# EasyEDA Pro project six-port-baseboard-v01.epro, schematic 六接口底板_V01, sheets 11 to 12 of 12

## Sheets
11 11_RL-RR支路无源器件: Schematic Name: 六接口底板_V01
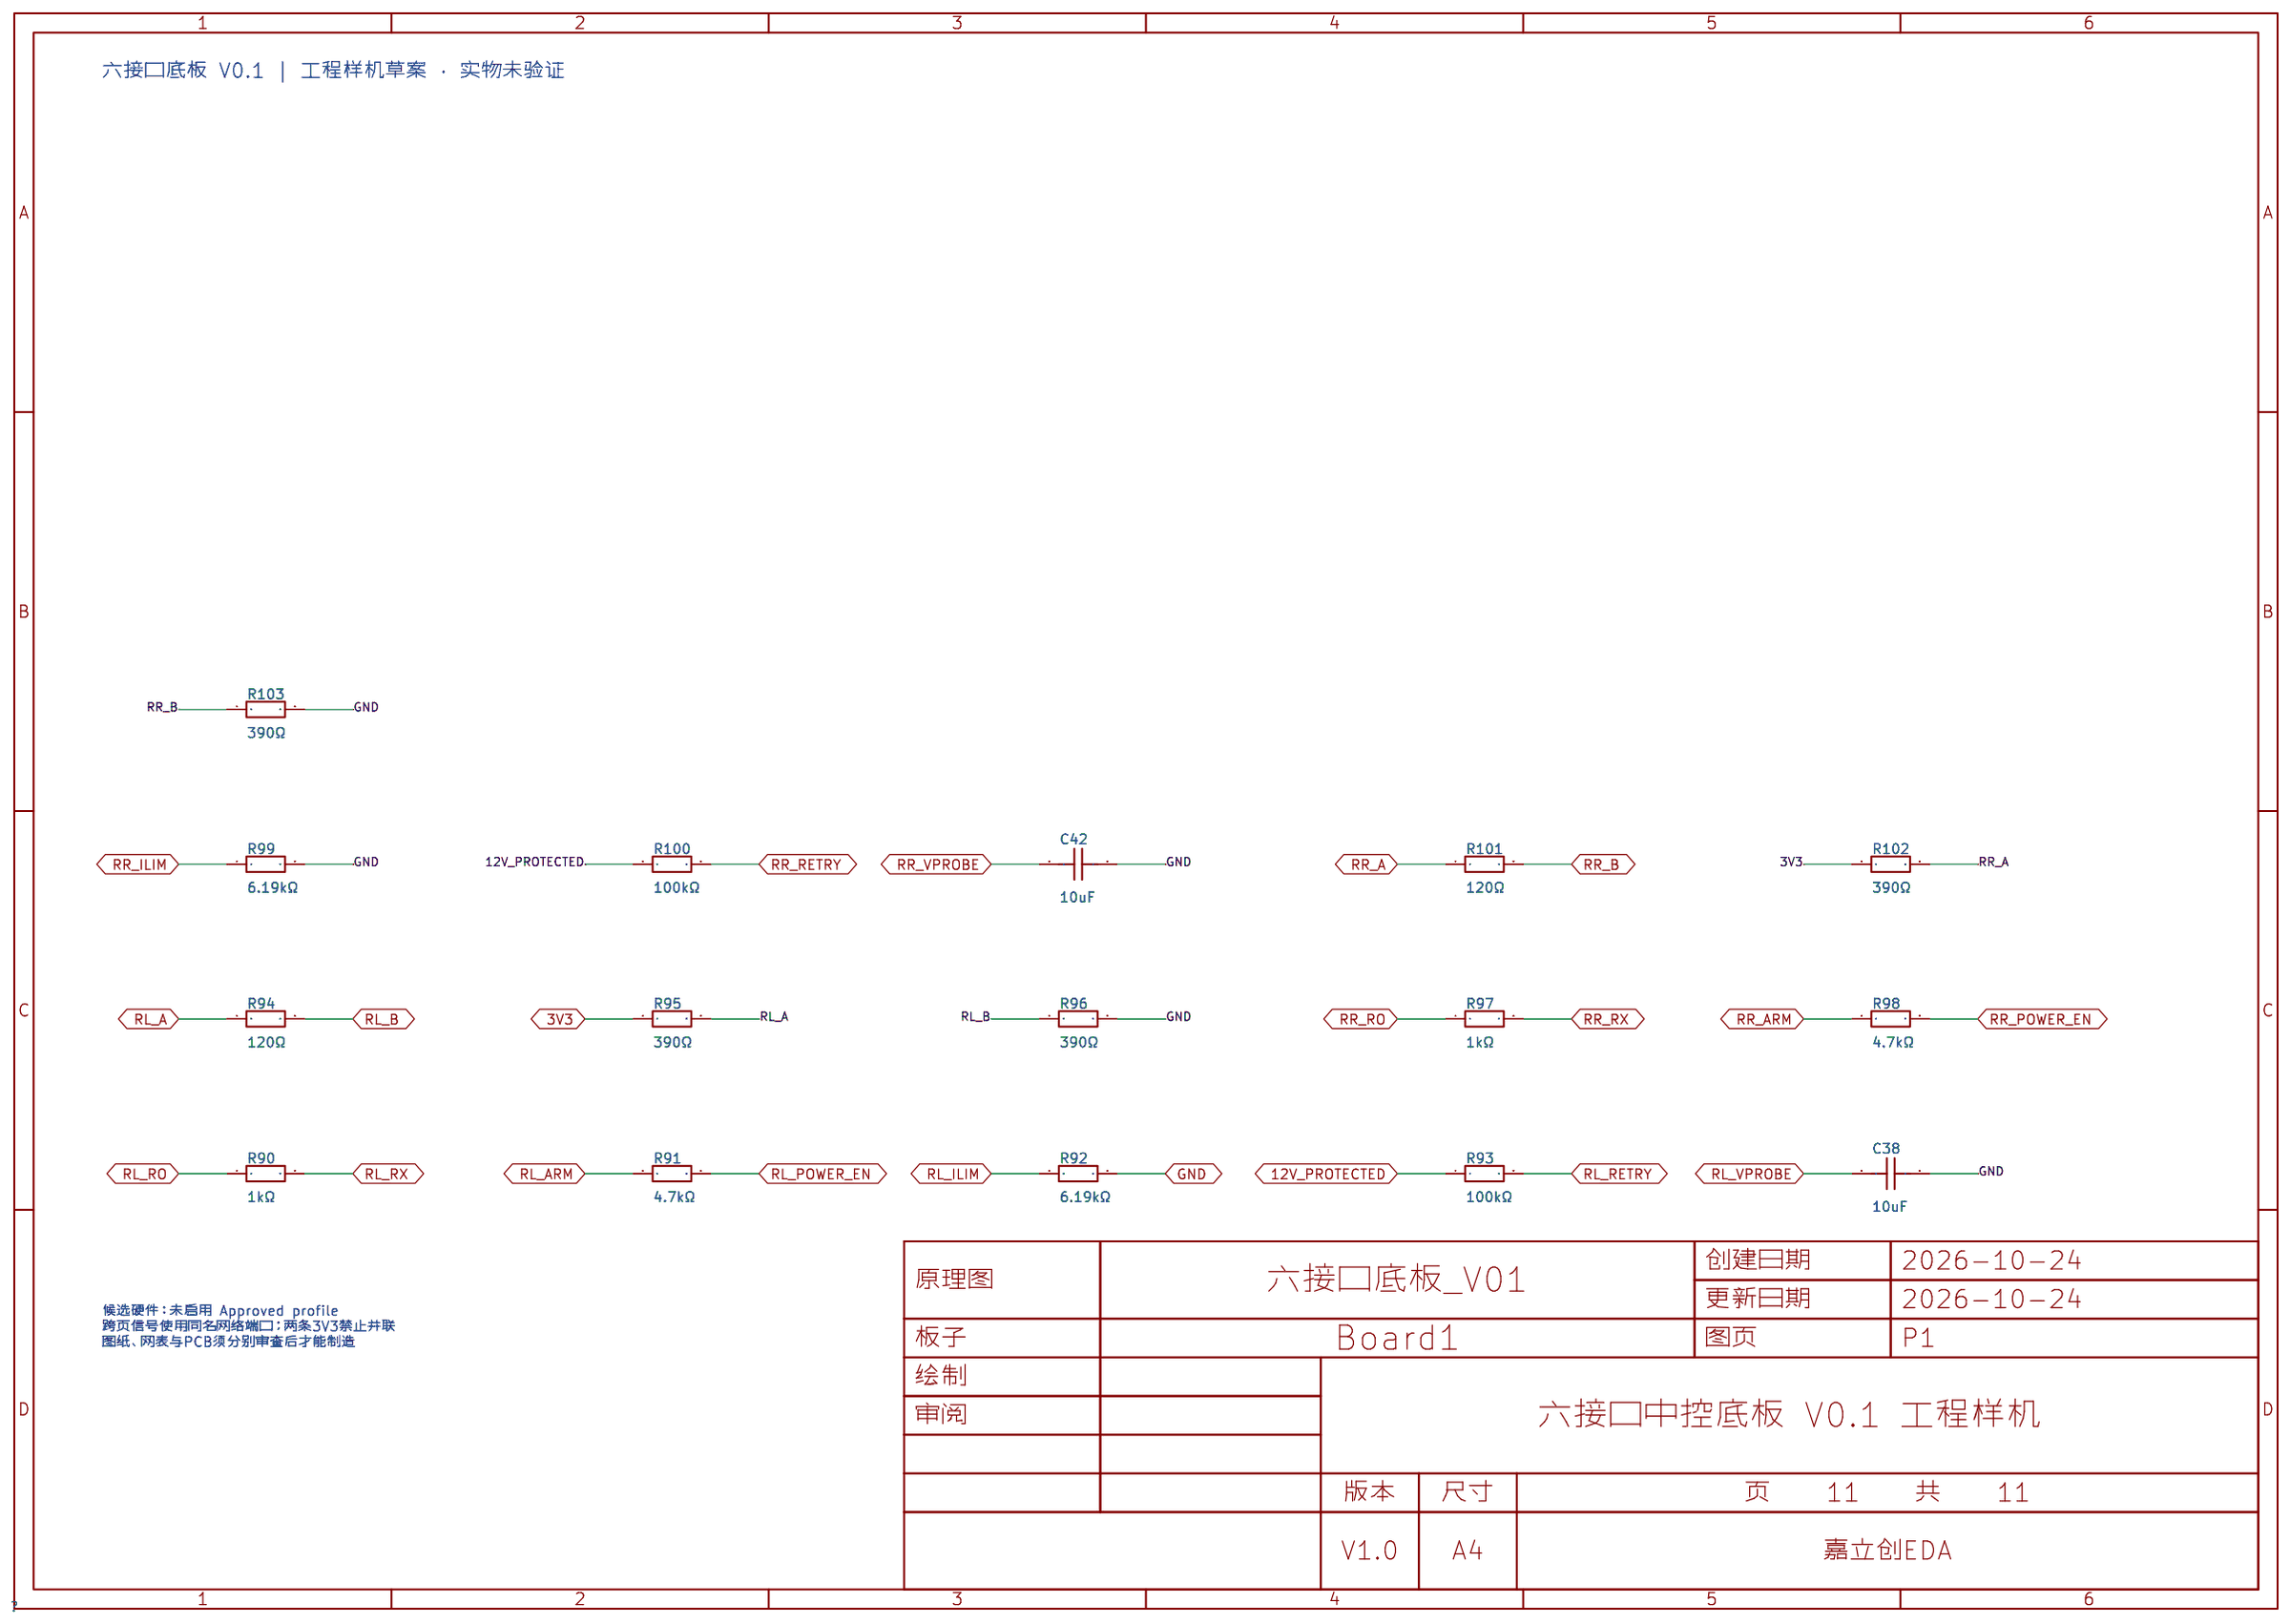
[diagram p10: 11_RL-RR支路无源器件]
12 12_BL-BR支路无源器件: Schematic Name: 六接口底板_V01
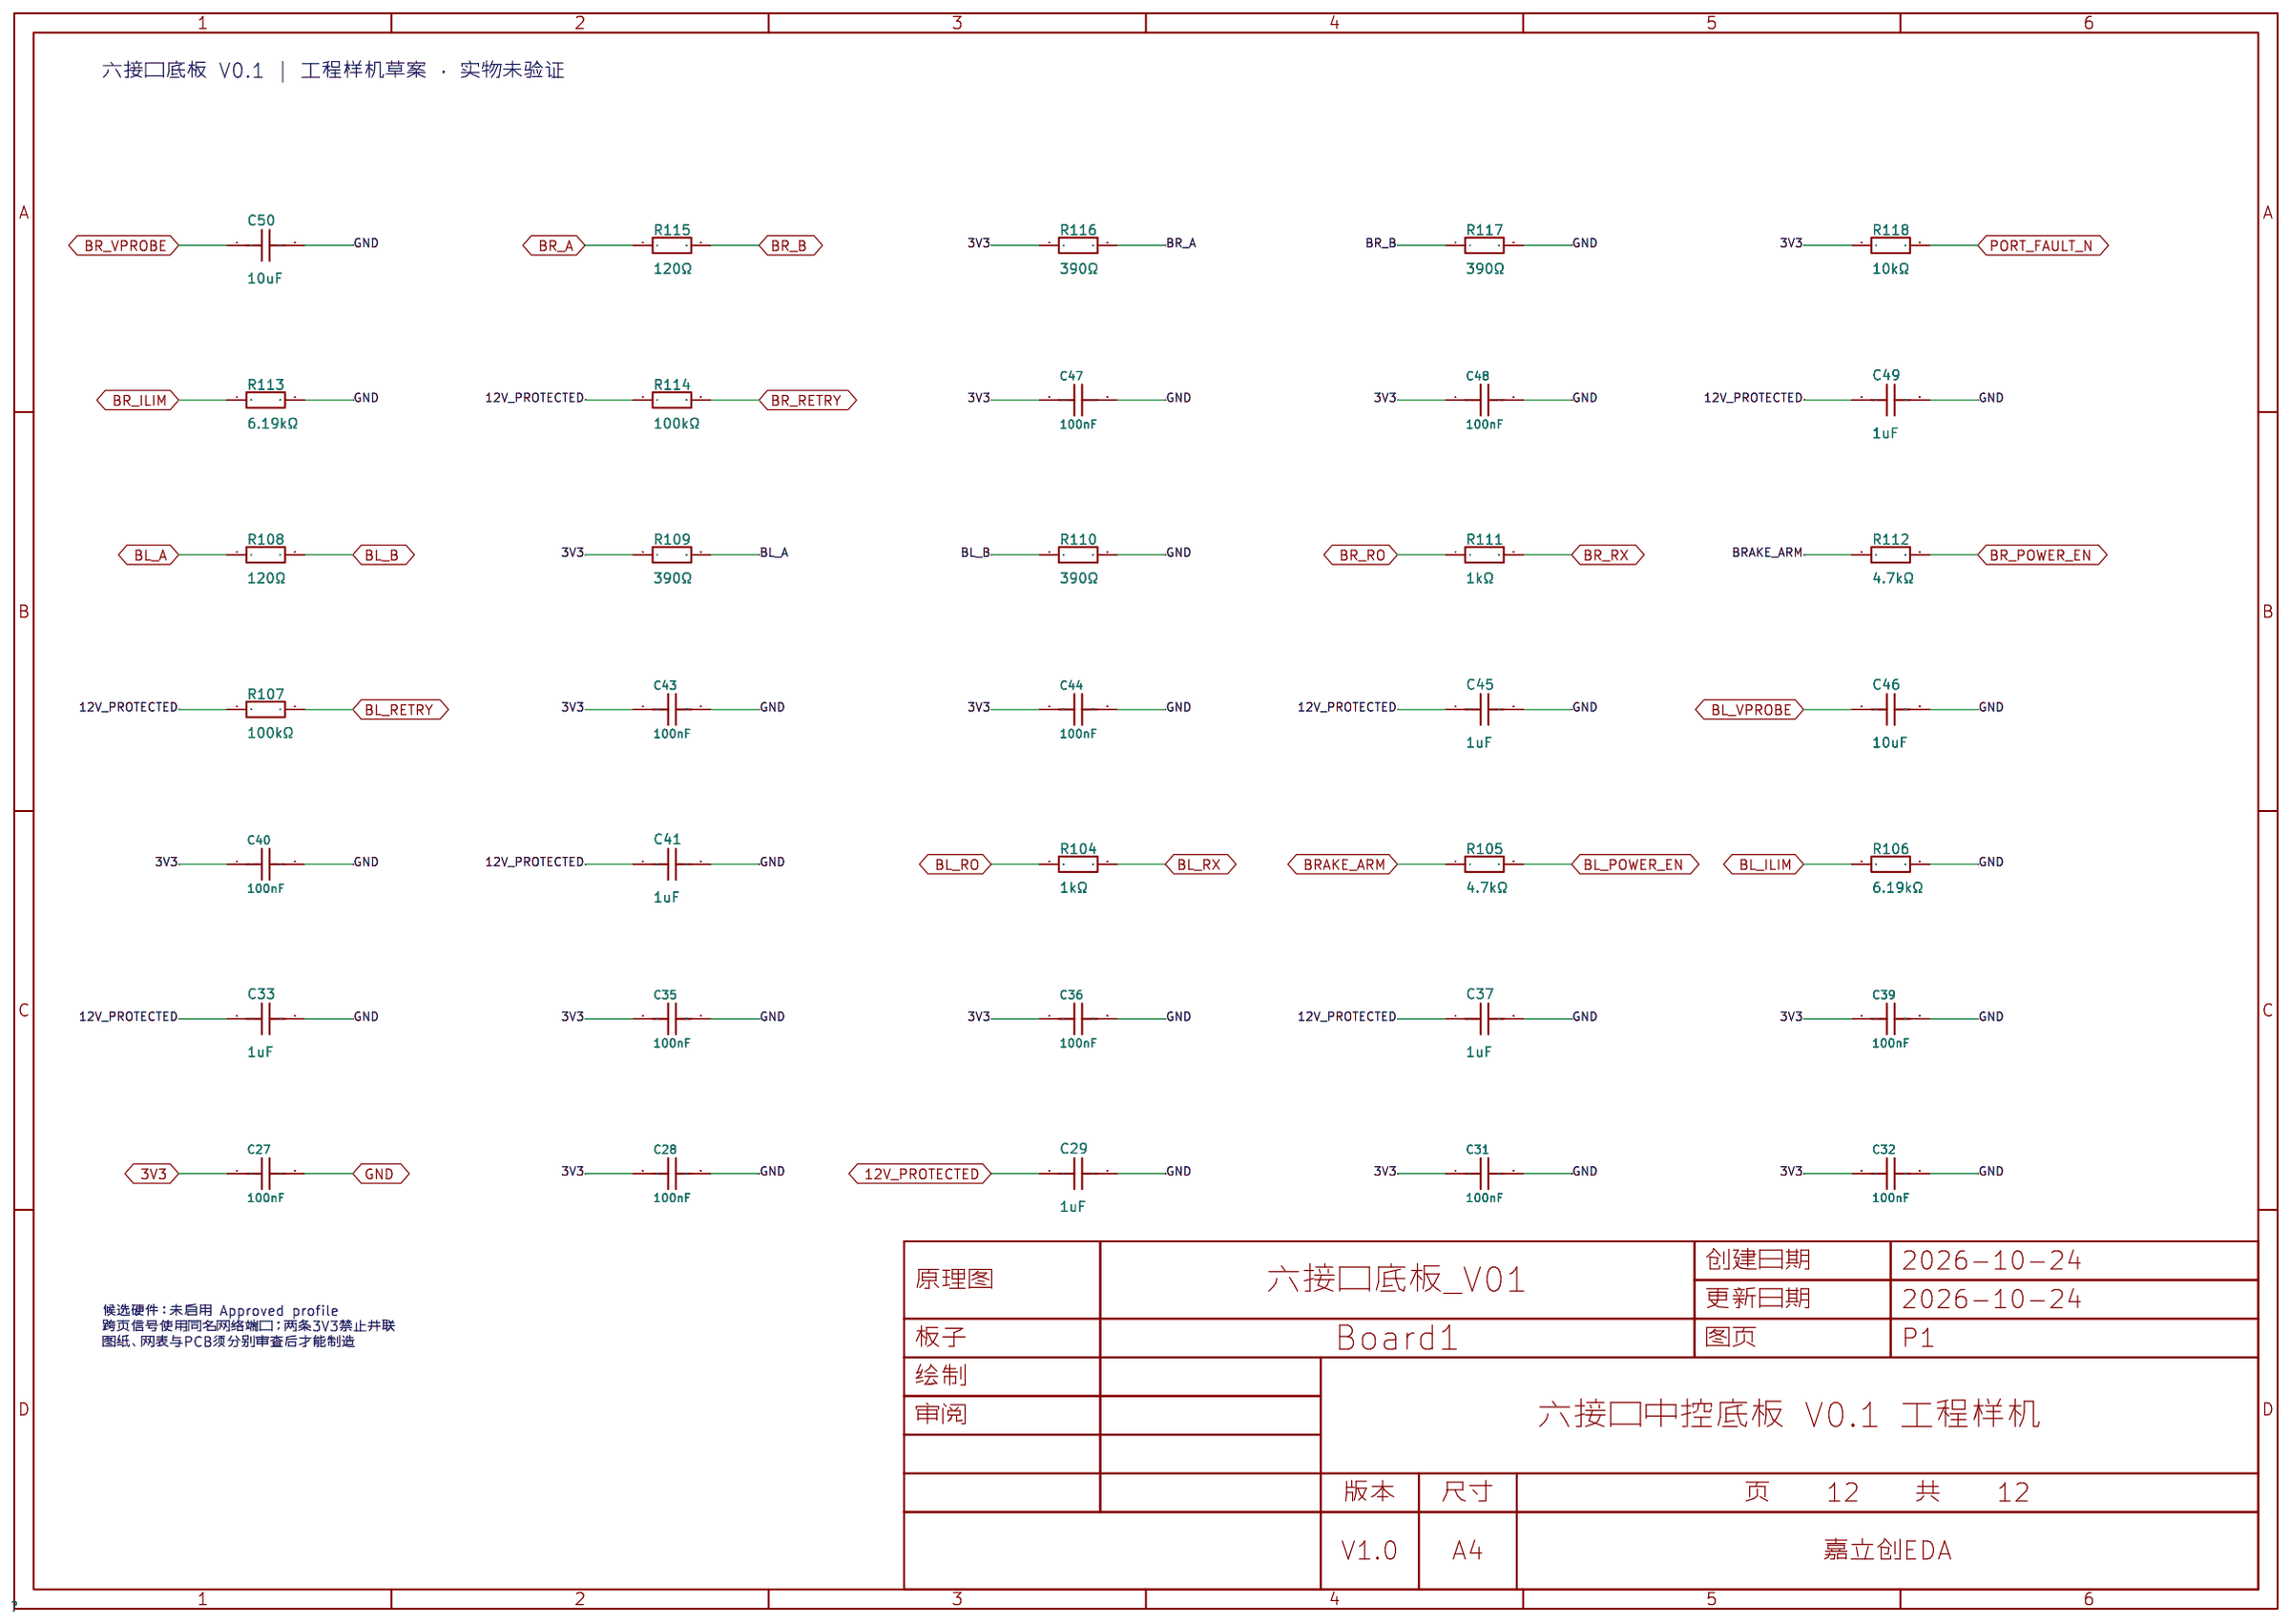
[diagram p11: 12_BL-BR支路无源器件]

## Parts
sheet 11_RL-RR支路无源器件
C38  10uF  [C0805]
C42  10uF  [C0805]
R90  1kΩ  [R0603]
R91  4.7kΩ  [R0603]
R92  6.19kΩ  [R0603]
R93  100kΩ  [R0603]
R94  120Ω  [R0603]  (no BOM)
R95  390Ω  [R0603]  (no BOM)
R96  390Ω  [R0603]  (no BOM)
R97  1kΩ  [R0603]
R98  4.7kΩ  [R0603]
R99  6.19kΩ  [R0603]
R100  100kΩ  [R0603]
R101  120Ω  [R0603]  (no BOM)
R102  390Ω  [R0603]  (no BOM)
R103  390Ω  [R0603]  (no BOM)
sheet 12_BL-BR支路无源器件
C27  100nF  [C0603]
C28  100nF  [C0603]
C29  1uF  [C0603]
C31  100nF  [C0603]
C32  100nF  [C0603]
C33  1uF  [C0603]
C35  100nF  [C0603]
C36  100nF  [C0603]
C37  1uF  [C0603]
C39  100nF  [C0603]
C40  100nF  [C0603]
C41  1uF  [C0603]
C43  100nF  [C0603]
C44  100nF  [C0603]
C45  1uF  [C0603]
C46  10uF  [C0805]
C47  100nF  [C0603]
C48  100nF  [C0603]
C49  1uF  [C0603]
C50  10uF  [C0805]
R104  1kΩ  [R0603]
R105  4.7kΩ  [R0603]
R106  6.19kΩ  [R0603]
R107  100kΩ  [R0603]
R108  120Ω  [R0603]  (no BOM)
R109  390Ω  [R0603]  (no BOM)
R110  390Ω  [R0603]  (no BOM)
R111  1kΩ  [R0603]
R112  4.7kΩ  [R0603]
R113  6.19kΩ  [R0603]
R114  100kΩ  [R0603]
R115  120Ω  [R0603]  (no BOM)
R116  390Ω  [R0603]  (no BOM)
R117  390Ω  [R0603]  (no BOM)
R118  10kΩ  [R0603]

## Library data of the parts
C38 C42 C46 C50 = CL21A106KAYNNNE_C15850: 容值:10uF;精度:±10%;额定电压:25V;温度系数:X5R;; LCSC Part Name: 10uF ±10% 25V; Supplier Part: C15850; Manufacturer: SAMSUNG(三星); Manufacturer Part: CL21A106KAYNNNE; Supplier Footprint: 0805; JLCPCB Part Class: Basic Part; Datasheet: https://item.szlcsc.com/datasheet/CL21A106KAYNNNE/16532.html; Supplier: LCSC; Tolerance: ±10%; Voltage Rating: 25V; Temperature Coefficient: X5R; Catalog UUID: 8c1f4a9e9d204b148b36ce719c891bd1; DNP: false
R90 R97 R104 R111 = 0603WAF1001T5E: 电阻类型:厚膜电阻;阻值:1kΩ;精度:±1%;功率:100mW;工作电压:75V;温度系数:±100ppm/℃;; LCSC Part Name: 1kΩ ±1% 100mW 厚膜电阻; Supplier Part: C21190; Manufacturer: UNI-ROYAL(厚声); Supplier Footprint: 0603; JLCPCB Part Class: Basic Part; Datasheet: https://item.szlcsc.com/datasheet/0603WAF1001T5E/21904.html; Supplier: LCSC; Type: 厚膜电阻; Tolerance: ±1%; Power(Watts): 100mW; Voltage-Supply(Max): 75V; Temperature Coefficient: ±100ppm/℃; Operating Temperature: -55℃~+155℃; Catalog UUID: 18db11499a04403ba8c98e2f7a687fbc; DNP: false
R91 R98 R105 R112 = 0603WAF4701T5E: 电阻类型:厚膜电阻;阻值:4.7kΩ;精度:±1%;功率:100mW;工作电压:75V;温度系数:±100ppm/℃;; LCSC Part Name: 厚膜电阻 4.7kΩ ±1%; Supplier Part: C23162; Manufacturer: UNI-ROYAL(厚声); Supplier Footprint: 0603; JLCPCB Part Class: Basic Part; Datasheet: https://item.szlcsc.com/datasheet/0603WAF4701T5E/23889.html; Supplier: LCSC; Type: 厚膜电阻; Tolerance: ±1%; Power(Watts): 100mW; Voltage-Supply(Max): 75V; Temperature Coefficient: ±100ppm/℃; Operating Temperature: -55℃~+155℃; Catalog UUID: 0f0661658cdd4f45888ea39caf7e9650; DNP: false; Engineering Note: 4.7k MCU I/O fault current limiter per TI recommendation; IN and DIAG tied at IC side
R92 R99 R106 R113 = 0603WAF6191T5E: 电阻类型:厚膜电阻;阻值:6.19kΩ;精度:±1%;功率:100mW;工作电压:75V;温度系数:±100ppm/℃;; LCSC Part Name: 厚膜电阻 6.19kΩ ±1%; Supplier Part: C25978; Manufacturer: UNI-ROYAL(厚声); Supplier Footprint: 0603; JLCPCB Part Class: Extended Part; Datasheet: https://item.szlcsc.com/datasheet/0603WAF6191T5E/26721.html; Supplier: LCSC; Type: 厚膜电阻; Tolerance: ±1%; Power(Watts): 100mW; Voltage-Supply(Max): 75V; Temperature Coefficient: ±100ppm/℃; Operating Temperature: -55℃~+155℃; Catalog UUID: 8c2b200f2fe3403a8095e07ce7180a9f; DNP: false
R93 R100 R107 R114 = 0603WAF1003T5E: 电阻类型:厚膜电阻;阻值:100kΩ;精度:±1%;功率:100mW;工作电压:75V;温度系数:±100ppm/℃;; LCSC Part Name: 厚膜电阻 100kΩ ±1%; Supplier Part: C25803; Manufacturer: UNI-ROYAL(厚声); Supplier Footprint: 0603; JLCPCB Part Class: Basic Part; Datasheet: https://item.szlcsc.com/datasheet/0603WAF1003T5E/26546.html; Supplier: LCSC; Type: 厚膜电阻; Tolerance: ±1%; Power(Watts): 100mW; Voltage-Supply(Max): 75V; Temperature Coefficient: ±100ppm/℃; Operating Temperature: -55℃~+155℃; Catalog UUID: 40ff282b3d594c33b798d1707d8406cb; DNP: false
R94 R101 R108 R115 = 0603WAF1200T5E: 电阻类型:厚膜电阻;阻值:120Ω;精度:±1%;功率:100mW;工作电压:75V;温度系数:±100ppm/℃;; LCSC Part Name: 120Ω ±1% 100mW 厚膜电阻; Supplier Part: C22787; Manufacturer: UNI-ROYAL(厚声); Supplier Footprint: 0603; JLCPCB Part Class: Basic Part; Datasheet: https://item.szlcsc.com/datasheet/0603WAF1200T5E/23514.html; Supplier: LCSC; Type: 厚膜电阻; Tolerance: ±1%; Power(Watts): 100mW; Voltage-Supply(Max): 75V; Temperature Coefficient: ±100ppm/℃; Operating Temperature: -55℃~+155℃; Catalog UUID: 70ad7c7d259c46308522db94f14f808c; DNP: true; Engineering Note: DNP until probe end termination measured
R95 R96 R102 R103 R109 R110 R116 R117 = 0603WAF3900T5E: 电阻类型:厚膜电阻;阻值:390Ω;精度:±1%;功率:100mW;工作电压:75V;温度系数:±100ppm/℃;; LCSC Part Name: 厚膜电阻 390Ω ±1%; Supplier Part: C23151; Manufacturer: UNI-ROYAL(厚声); Supplier Footprint: 0603; JLCPCB Part Class: Basic Part; Datasheet: https://item.szlcsc.com/datasheet/0603WAF3900T5E/23878.html; Supplier: LCSC; Type: 厚膜电阻; Tolerance: ±1%; Power(Watts): 100mW; Voltage-Supply(Max): 75V; Temperature Coefficient: ±100ppm/℃; Operating Temperature: -55℃~+155℃; Catalog UUID: 3a149519c47e492384526af469a473e0; DNP: true; Engineering Note: DNP; built-in fail-safe used initially
C27 C28 C31 C32 C35 C36 C39 C40 C43 C44 C47 C48 = CC0603KRX7R9BB104: 容值:100nF;精度:±10%;额定电压:50V;温度系数:X7R;; LCSC Part Name: 100nF ±10% 50V; Supplier Part: C14663; Manufacturer: YAGEO(国巨); Supplier Footprint: 0603; JLCPCB Part Class: Basic Part; Datasheet: https://item.szlcsc.com/datasheet/CC0603KRX7R9BB104/15331.html; Supplier: LCSC; Tolerance: ±10%; Voltage Rating: 50V; Temperature Coefficient: X7R; Catalog UUID: 96b39256cc3f4d80bd3b503deb4f3328; DNP: false
C29 C33 C37 C41 C45 C49 = CL10A105KB8NNNC: 容值:1uF;精度:±10%;额定电压:50V;温度系数:X5R;; LCSC Part Name: 1uF ±10% 50V; Supplier Part: C15849; Manufacturer: SAMSUNG(三星); Supplier Footprint: 0603; JLCPCB Part Class: Basic Part; Datasheet: https://item.szlcsc.com/datasheet/CL10A105KB8NNNC/16531.html; Supplier: LCSC; Tolerance: ±10%; Voltage Rating: 50V; Temperature Coefficient: X5R; Catalog UUID: f4744ff7405a46a48e360c2c6fadeca3; DNP: false
R118 = 0603WAF1002T5E: 电阻类型:厚膜电阻;阻值:10kΩ;精度:±1%;功率:100mW;工作电压:75V;温度系数:±100ppm/℃;; LCSC Part Name: 厚膜电阻 10kΩ ±1% 100mW; Supplier Part: C25804; Manufacturer: UNI-ROYAL(厚声); Supplier Footprint: 0603; JLCPCB Part Class: Basic Part; Datasheet: https://item.szlcsc.com/datasheet/0603WAF1002T5E/26547.html; Supplier: LCSC; Type: 厚膜电阻; Tolerance: ±1%; Power(Watts): 100mW; Voltage-Supply(Max): 75V; Temperature Coefficient: ±100ppm/℃; Operating Temperature: -55℃~+155℃; Catalog UUID: b948db94476e4027ac8953235755ec96; DNP: false

## Nets
3V3: C27.1 C28.1 C31.1 C32.1 C35.1 C36.1 C39.1 C40.1 C43.1 C44.1 C47.1 C48.1 R95.1 R102.1 R109.1 R116.1 R118.1 ; also on sheet 1 2 3 4 5 6 7 8 9 10
12V_PROTECTED: C29.1 C33.1 C37.1 C41.1 C45.1 C49.1 R93.1 R100.1 R107.1 R114.1 ; also on sheet 3 4 9 10
GND: C27.2 C28.2 C29.2 C31.2 C32.2 C33.2 C35.2 C36.2 C37.2 C38.2 C39.2 C40.2 C41.2 C42.2 C43.2 C44.2 C45.2 C46.2 C47.2 C48.2 C49.2 C50.2 R92.2 R96.2 R99.2 R103.2 R106.2 R110.2 R113.2 R117.2 ; also on sheet 1 2 3 4 5 6 7 8 9 10
BL_A: R108.1 R109.2 ; also on sheet 3
BL_B: R108.2 R110.1 ; also on sheet 3
BL_ILIM: R106.1 ; also on sheet 3
BL_POWER_EN: R105.2 ; also on sheet 3
BL_RETRY: R107.2 ; also on sheet 3
BL_RO: R104.1 ; also on sheet 3
BL_RX: R104.2 ; also on sheet 2
BL_VPROBE: C46.1 ; also on sheet 3
BR_A: R115.1 R116.2 ; also on sheet 3
BR_B: R115.2 R117.1 ; also on sheet 3
BR_ILIM: R113.1 ; also on sheet 3
BR_POWER_EN: R112.2 ; also on sheet 3
BR_RETRY: R114.2 ; also on sheet 3
BR_RO: R111.1 ; also on sheet 3
BR_RX: R111.2 ; also on sheet 2
BR_VPROBE: C50.1 ; also on sheet 3
BRAKE_ARM: R105.1 R112.1 ; also on sheet 2 3
PORT_FAULT_N: R118.2 ; also on sheet 2 3
RL_A: R94.1 R95.2 ; also on sheet 3
RL_ARM: R91.1 ; also on sheet 3 6
RL_B: R94.2 R96.1 ; also on sheet 3
RL_ILIM: R92.1 ; also on sheet 3
RL_POWER_EN: R91.2 ; also on sheet 3
RL_RETRY: R93.2 ; also on sheet 3
RL_RO: R90.1 ; also on sheet 3
RL_RX: R90.2 ; also on sheet 6
RL_VPROBE: C38.1 ; also on sheet 3
RR_A: R101.1 R102.2 ; also on sheet 3
RR_ARM: R98.1 ; also on sheet 3 7
RR_B: R101.2 R103.1 ; also on sheet 3
RR_ILIM: R99.1 ; also on sheet 3
RR_POWER_EN: R98.2 ; also on sheet 3
RR_RETRY: R100.2 ; also on sheet 3
RR_RO: R97.1 ; also on sheet 3
RR_RX: R97.2 ; also on sheet 7
RR_VPROBE: C42.1 ; also on sheet 3

## Notes on the sheets
sheet 11
- 六接口底板 V0.1 | 工程样机草案 · 实物未验证
- 候选硬件：未启用 Approved profile
  跨页信号使用同名网络端口；两条3V3禁止并联
  图纸、网表与PCB须分别审查后才能制造
sheet 12
- 六接口底板 V0.1 | 工程样机草案 · 实物未验证
- 候选硬件：未启用 Approved profile
  跨页信号使用同名网络端口；两条3V3禁止并联
  图纸、网表与PCB须分别审查后才能制造
